# Altium schematic sheet _TOP_List.SchDoc: Studio Clock
size A4; Revision: V1.00; SheetNumber: 2; SheetTotal: 16
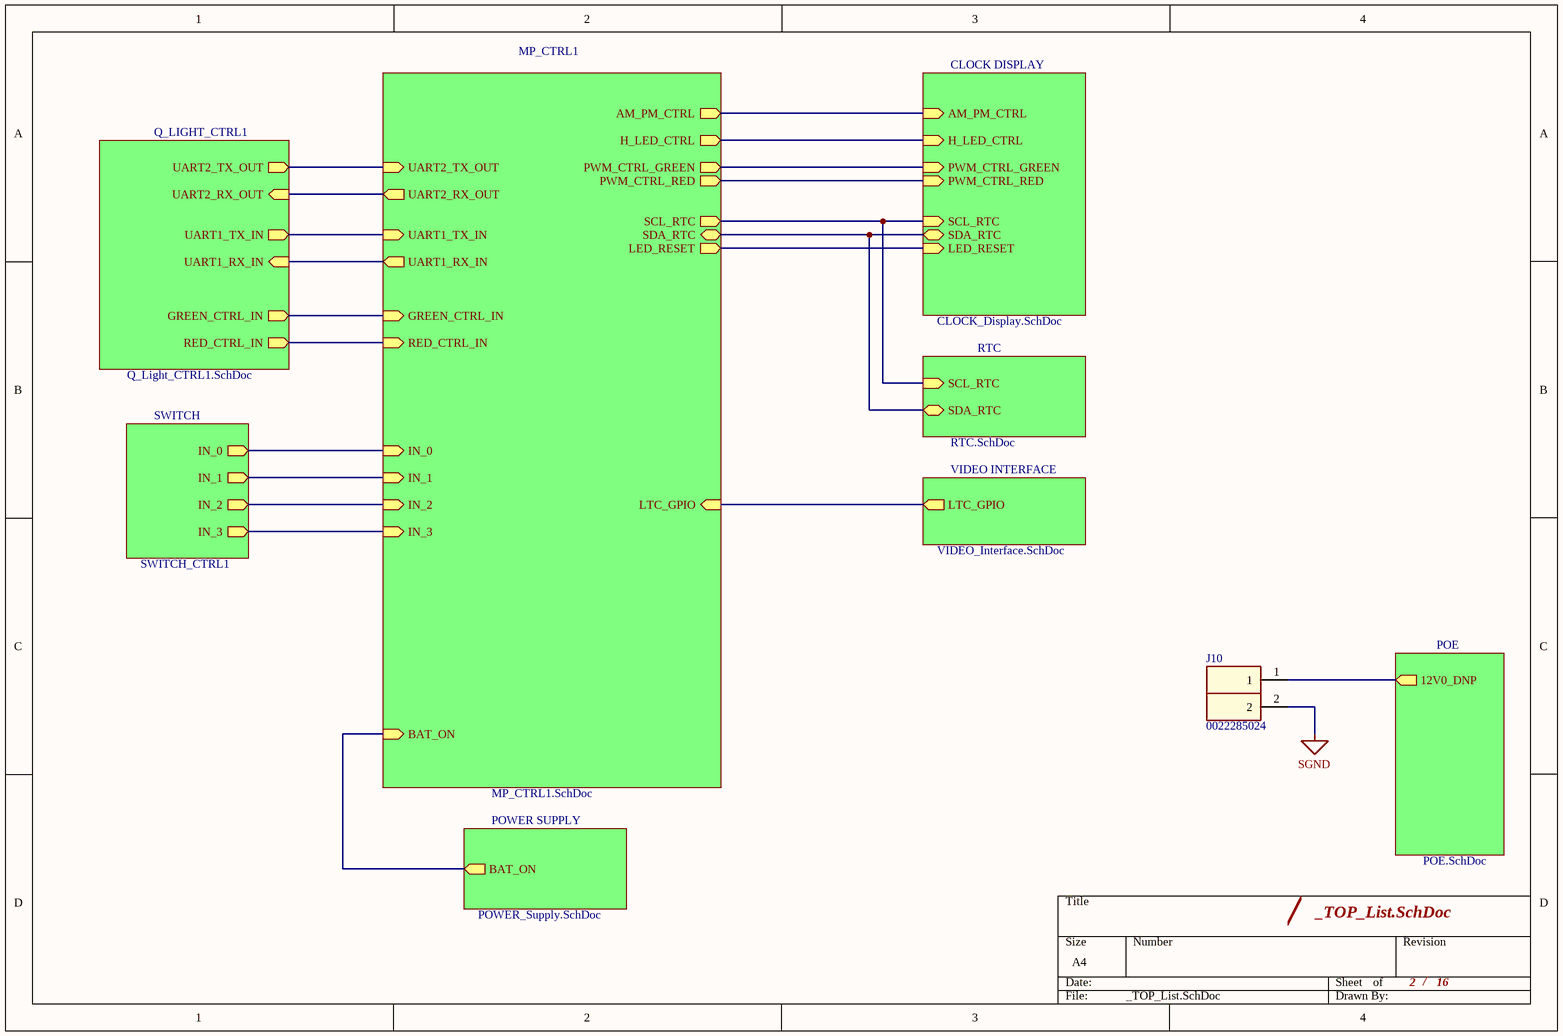
[diagram p0: _TOP_List.SchDoc]

## Parts
J10  0022285024  [PLS-02]

## Sub-sheets
CLOCK DISPLAY = CLOCK_Display.SchDoc: AM_PM_CTRL (in), H_LED_CTRL (in), PWM_CTRL_GREEN (in), PWM_CTRL_RED (in), SDA_RTC (bidir), SCL_RTC (in), LED_RESET (in)
MP_CTRL1 = MP_CTRL1.SchDoc: IN_0 (in), IN_1 (in), IN_2 (in), IN_3 (in), UART1_TX_IN (in), UART1_RX_IN (out), GREEN_CTRL_IN (in), RED_CTRL_IN (in), LTC_GPIO (in), AM_PM_CTRL (out), H_LED_CTRL (out), PWM_CTRL_GREEN (out), PWM_CTRL_RED (out), BAT_ON (in), SDA_RTC (bidir), SCL_RTC (out), LED_RESET (out), UART2_TX_OUT (in), UART2_RX_OUT (out)
POE = POE.SchDoc: 12V0_DNP (out)
POWER SUPPLY = POWER_Supply.SchDoc: BAT_ON (out)
Q_LIGHT_CTRL1 = Q_Light_CTRL1.SchDoc: UART1_TX_IN (out), UART1_RX_IN (in), GREEN_CTRL_IN (out), RED_CTRL_IN (out), UART2_TX_OUT (out), UART2_RX_OUT (in)
RTC = RTC.SchDoc: SDA_RTC (bidir), SCL_RTC (in)
SWITCH = SWITCH_CTRL1: IN_0 (out), IN_1 (out), IN_2 (out), IN_3 (out)
VIDEO INTERFACE = VIDEO_Interface.SchDoc: LTC_GPIO (out)

## Nets
SGND: J10.2
NetJ10_1: J10.1 ; sheet POE/12V0_DNP
(unnamed): sheet Q_LIGHT_CTRL1/UART1_TX_IN, sheet MP_CTRL1/UART1_TX_IN
(unnamed): sheet Q_LIGHT_CTRL1/UART1_RX_IN, sheet MP_CTRL1/UART1_RX_IN
(unnamed): sheet Q_LIGHT_CTRL1/GREEN_CTRL_IN, sheet MP_CTRL1/GREEN_CTRL_IN
(unnamed): sheet Q_LIGHT_CTRL1/RED_CTRL_IN, sheet MP_CTRL1/RED_CTRL_IN
(unnamed): sheet Q_LIGHT_CTRL1/UART2_TX_OUT, sheet MP_CTRL1/UART2_TX_OUT
(unnamed): sheet Q_LIGHT_CTRL1/UART2_RX_OUT, sheet MP_CTRL1/UART2_RX_OUT
(unnamed): sheet SWITCH/IN_0, sheet MP_CTRL1/IN_0
(unnamed): sheet SWITCH/IN_1, sheet MP_CTRL1/IN_1
(unnamed): sheet SWITCH/IN_2, sheet MP_CTRL1/IN_2
(unnamed): sheet SWITCH/IN_3, sheet MP_CTRL1/IN_3
(unnamed): sheet MP_CTRL1/LTC_GPIO, sheet VIDEO INTERFACE/LTC_GPIO
(unnamed): sheet MP_CTRL1/AM_PM_CTRL, sheet CLOCK DISPLAY/AM_PM_CTRL
(unnamed): sheet MP_CTRL1/H_LED_CTRL, sheet CLOCK DISPLAY/H_LED_CTRL
(unnamed): sheet MP_CTRL1/PWM_CTRL_GREEN, sheet CLOCK DISPLAY/PWM_CTRL_GREEN
(unnamed): sheet MP_CTRL1/PWM_CTRL_RED, sheet CLOCK DISPLAY/PWM_CTRL_RED
(unnamed): sheet MP_CTRL1/BAT_ON, sheet POWER SUPPLY/BAT_ON
(unnamed): sheet MP_CTRL1/SDA_RTC, sheet CLOCK DISPLAY/SDA_RTC, sheet RTC/SDA_RTC
(unnamed): sheet MP_CTRL1/SCL_RTC, sheet CLOCK DISPLAY/SCL_RTC, sheet RTC/SCL_RTC
(unnamed): sheet MP_CTRL1/LED_RESET, sheet CLOCK DISPLAY/LED_RESET

## Notes on the sheet
- /

## Library data of the parts
J10 = PLS_02: CONN HEADER VERT 2POS 2.54MM; MAnufacturer: MOLEX; MPN: 0022285024